# Altium schematic sheet Commucation.SchDoc
size A; SheetNumber: 2; SheetTotal: 3
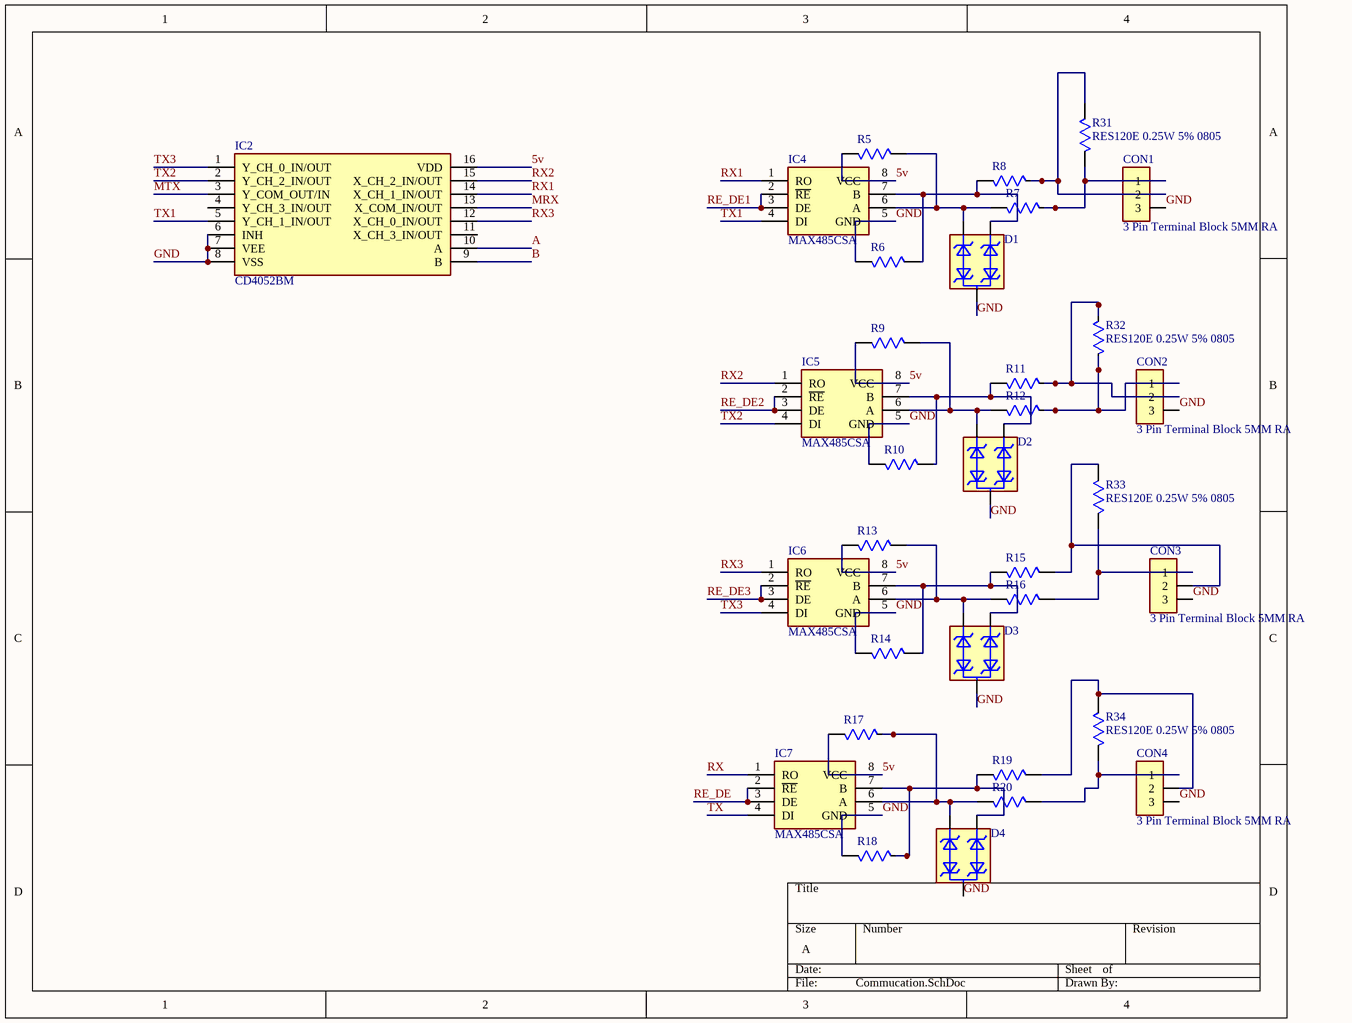
[diagram p0: Commucation.SchDoc]

## Parts
CON1  3 Pin Terminal Block 5MM RA  [3 Pin Terminal Block 5MM RA]
CON2  3 Pin Terminal Block 5MM RA  [3 Pin Terminal Block 5MM RA]
CON3  3 Pin Terminal Block 5MM RA  [3 Pin Terminal Block 5MM RA]
CON4  3 Pin Terminal Block 5MM RA  [3 Pin Terminal Block 5MM RA]
D1  SM712-02HTG  [SOT23]  (value not drawn)
D2  SM712-02HTG  [SOT23]  (value not drawn)
D3  SM712-02HTG  [SOT23]  (value not drawn)
D4  SM712-02HTG  [SOT23]  (value not drawn)
IC2  CD4052BM  [SOIC127P600X175-16N]
IC4  MAX485CSA  [SOIC127P600X175-8N]
IC5  MAX485CSA  [SOIC127P600X175-8N]
IC6  MAX485CSA  [SOIC127P600X175-8N]
IC7  MAX485CSA  [SOIC127P600X175-8N]
R5  RES4.7K 0.25W 5% 0805  [RES 0805 10K/0.25W 5%]  (value not drawn)
R6  RES4.7K 0.25W 5% 0805  [RES 0805 10K/0.25W 5%]  (value not drawn)
R7  RES100E 0.25W 5% 0805  [RES 0805 10K/0.25W 5%]  (value not drawn)
R8  RES100E 0.25W 5% 0805  [RES 0805 10K/0.25W 5%]  (value not drawn)
R9  RES4.7K 0.25W 5% 0805  [RES 0805 10K/0.25W 5%]  (value not drawn)
R10  RES4.7K 0.25W 5% 0805  [RES 0805 10K/0.25W 5%]  (value not drawn)
R11  RES100E 0.25W 5% 0805  [RES 0805 10K/0.25W 5%]  (value not drawn)
R12  RES100E 0.25W 5% 0805  [RES 0805 10K/0.25W 5%]  (value not drawn)
R13  RES4.7K 0.25W 5% 0805  [RES 0805 10K/0.25W 5%]  (value not drawn)
R14  RES4.7K 0.25W 5% 0805  [RES 0805 10K/0.25W 5%]  (value not drawn)
R15  RES100E 0.25W 5% 0805  [RES 0805 10K/0.25W 5%]  (value not drawn)
R16  RES100E 0.25W 5% 0805  [RES 0805 10K/0.25W 5%]  (value not drawn)
R17  RES4.7K 0.25W 5% 0805  [RES 0805 10K/0.25W 5%]  (value not drawn)
R18  RES4.7K 0.25W 5% 0805  [RES 0805 10K/0.25W 5%]  (value not drawn)
R19  RES100E 0.25W 5% 0805  [RES 0805 10K/0.25W 5%]  (value not drawn)
R20  RES100E 0.25W 5% 0805  [RES 0805 10K/0.25W 5%]  (value not drawn)
R31  RES120E 0.25W 5% 0805  [RES 0805 10K/0.25W 5%]
R32  RES120E 0.25W 5% 0805  [RES 0805 10K/0.25W 5%]
R33  RES120E 0.25W 5% 0805  [RES 0805 10K/0.25W 5%]
R34  RES120E 0.25W 5% 0805  [RES 0805 10K/0.25W 5%]

## Nets
5v: IC2.16(VDD) IC4.8(VCC) IC5.8(VCC) IC6.8(VCC) IC7.8(VCC) R5.1 R9.1 R13.1 R17.1
A: IC2.10(A)
B: IC2.9(B)
GND: CON1.3 CON2.3 CON3.3 CON4.3 D1.3 D2.3 D3.3 D4.3 IC2.6(INH) IC2.7(VEE) IC2.8(VSS) IC4.5(GND) IC5.5(GND) IC6.5(GND) IC7.5(GND) R6.1 R10.1 R14.1 R18.1
MRX: IC2.13(X_COM_IN/OUT)
MTX: IC2.3(Y_COM_OUT/IN)
RE_DE: IC7.2(~{RE}) IC7.3(DE)
RE_DE1: IC4.2(~{RE}) IC4.3(DE)
RE_DE2: IC5.2(~{RE}) IC5.3(DE)
RE_DE3: IC6.2(~{RE}) IC6.3(DE)
RX: IC7.1(RO)
RX1: IC2.14(X_CH_1_IN/OUT) IC4.1(RO)
RX2: IC2.15(X_CH_2_IN/OUT) IC5.1(RO)
RX3: IC2.12(X_CH_0_IN/OUT) IC6.1(RO)
TX: IC7.4(DI)
TX1: IC2.5(Y_CH_1_IN/OUT) IC4.4(DI)
TX2: IC2.2(Y_CH_2_IN/OUT) IC5.4(DI)
TX3: IC2.1(Y_CH_0_IN/OUT) IC6.4(DI)
NetCON1_1: CON1.1 R7.2 R31.1
NetCON1_2: CON1.2 R8.2 R31.2
NetCON2_1: CON2.1 R12.2 R32.1
NetCON2_2: CON2.2 R11.2 R32.2
NetCON3_1: CON3.1 R16.2 R33.1
NetCON3_2: CON3.2 R15.2 R33.2
NetCON4_1: CON4.1 R20.2 R34.1
NetCON4_2: CON4.2 R19.2 R34.2
NetD1_1: D1.1 IC4.7(B) R6.2 R8.1
NetD1_2: D1.2 IC4.6(A) R5.2 R7.1
NetD2_1: D2.1 IC5.7(B) R10.2 R11.1
NetD2_2: D2.2 IC5.6(A) R9.2 R12.1
NetD3_1: D3.1 IC6.7(B) R14.2 R15.1
NetD3_2: D3.2 IC6.6(A) R13.2 R16.1
NetD4_1: D4.1 IC7.7(B) R18.2 R19.1
NetD4_2: D4.2 IC7.6(A) R17.2 R20.1

Not connected (* = marked no-connect by the designer): IC2 4(Y_CH_3_IN/OUT) 11(X_CH_3_IN/OUT)

## Library data of the parts
CON1-CON4 = 3 Pin Terminal Block 5MM RA: 3 Pin Terminal Block HDR 5MM THT RA 231-433_001-000; MP: 231-433/001-000; MF: WAGO; SnapEDA_Link: https://www.snapeda.com/parts/231-433/001-000/WAGO/view-part/482062/?ref=snap; Package: None; Availability: Unavailable; Price: None; Value: *
D1-D4 = SM712-02HTG: TVS Diode, SM712 Series, 31V Clamp, 600W Peak Pulse, Surface Mount, SOT23-3 | Littelfuse SM712-02HTG; MF: Littelfuse Inc.; SnapEDA_Link: https://www.snapeda.com/parts/SM712-02HTG/Littelfuse/view-part/?ref=snap; Package: SOT-23 Littelfuse Inc.; Value: *; MP: SM712-02HTG; Check_prices: https://www.snapeda.com/parts/SM712-02HTG/Littelfuse/view-part/?ref=eda
IC2 = CD4052BM: CMOS Differential 4-Channel Analog Multiplexer/Demultiplexer with Logic-Level Conversion; Manufacturer_Name: Texas Instruments; Geometry.Height: 1.75mm; Manufacturer_Part_Number: CD4052BM; Mouser Part Number: 595-CD4052BM; Mouser Price/Stock: https://www.mouser.co.uk/ProductDetail/Texas-Instruments/CD4052BM?qs=LSR%252BNeaw%2FwAMfT6cddU6yA%3D%3D; Arrow Part Number: CD4052BM; Arrow Price/Stock: https://www.arrow.com/en/products/cd4052bm/texas-instruments?region=nac; Datasheet Link: http://www.ti.com/lit/ds/symlink/cd4052b.pdf
IC4-IC7 = MAX485CSA: Maxim MAX485CSA, Line Transceiver, RS-422, RS-485, 4.75  5.25 V, 8-Pin SOIC; Manufacturer_Name: Analog Devices; Geometry.Height: 1.75mm; Manufacturer_Part_Number: MAX485CSA; Mouser Part Number: N/A; Mouser Price/Stock: https://www.mouser.co.uk/ProductDetail/Maxim-Integrated/MAX485CSA?qs=LHmEVA8xxfbb%2FSUlm%252BHF3Q%3D%3D; Arrow Part Number: *; Arrow Price/Stock: *; Datasheet Link: https://datasheets.maximintegrated.com/en/ds/MAX1487-MAX491.pdf
R5 = RES 10K 0.25W 5% 0805: RESISTOR, THICK FILM, 4.7K, 5%, 0805 0.25W SMT; MP: ERJ-6GEYJ103V; MF: Panasonic Electronic; Price: None; Check_prices: https://www.snapeda.com/parts/ERJ-6GEYJ103V/Panasonic+Electronic+Components/view-part/?ref=eda; Package: 805-2 Panasonic; Purchase-URL: https://pricing.snapeda.com/search/part/ERJ-6GEYJ103V/?ref=eda; Availability: In Stock; SnapEDA_Link: https://www.snapeda.com/parts/ERJ-6GEYJ103V/Panasonic+Electronic+Components/view-part/?ref=snap; Value: *
R6-R20 = RES 10K 0.25W 5% 0805: RESISTOR, THICK FILM, 10K, 5%, 0805 0.25W SMT; MP: ERJ-6GEYJ103V; MF: Panasonic Electronic; Price: None; Check_prices: https://www.snapeda.com/parts/ERJ-6GEYJ103V/Panasonic+Electronic+Components/view-part/?ref=eda; Package: 805-2 Panasonic; Purchase-URL: https://pricing.snapeda.com/search/part/ERJ-6GEYJ103V/?ref=eda; Availability: In Stock; SnapEDA_Link: https://www.snapeda.com/parts/ERJ-6GEYJ103V/Panasonic+Electronic+Components/view-part/?ref=snap; Value: *
R31-R34 = RES 10K 0.25W 5% 0805_1: RESISTOR, THICK FILM, 10K, 5%, 0805 0.25W SMT; MP: ERJ-6GEYJ103V; MF: Panasonic Electronic; Price: None; Check_prices: https://www.snapeda.com/parts/ERJ-6GEYJ103V/Panasonic+Electronic+Components/view-part/?ref=eda; Package: 805-2 Panasonic; Purchase-URL: https://pricing.snapeda.com/search/part/ERJ-6GEYJ103V/?ref=eda; Availability: In Stock; SnapEDA_Link: https://www.snapeda.com/parts/ERJ-6GEYJ103V/Panasonic+Electronic+Components/view-part/?ref=snap; Value: *